# Altium schematic sheet Harici_Birimler.SchDoc
size A4; SheetNumber: 5; SheetTotal: 6
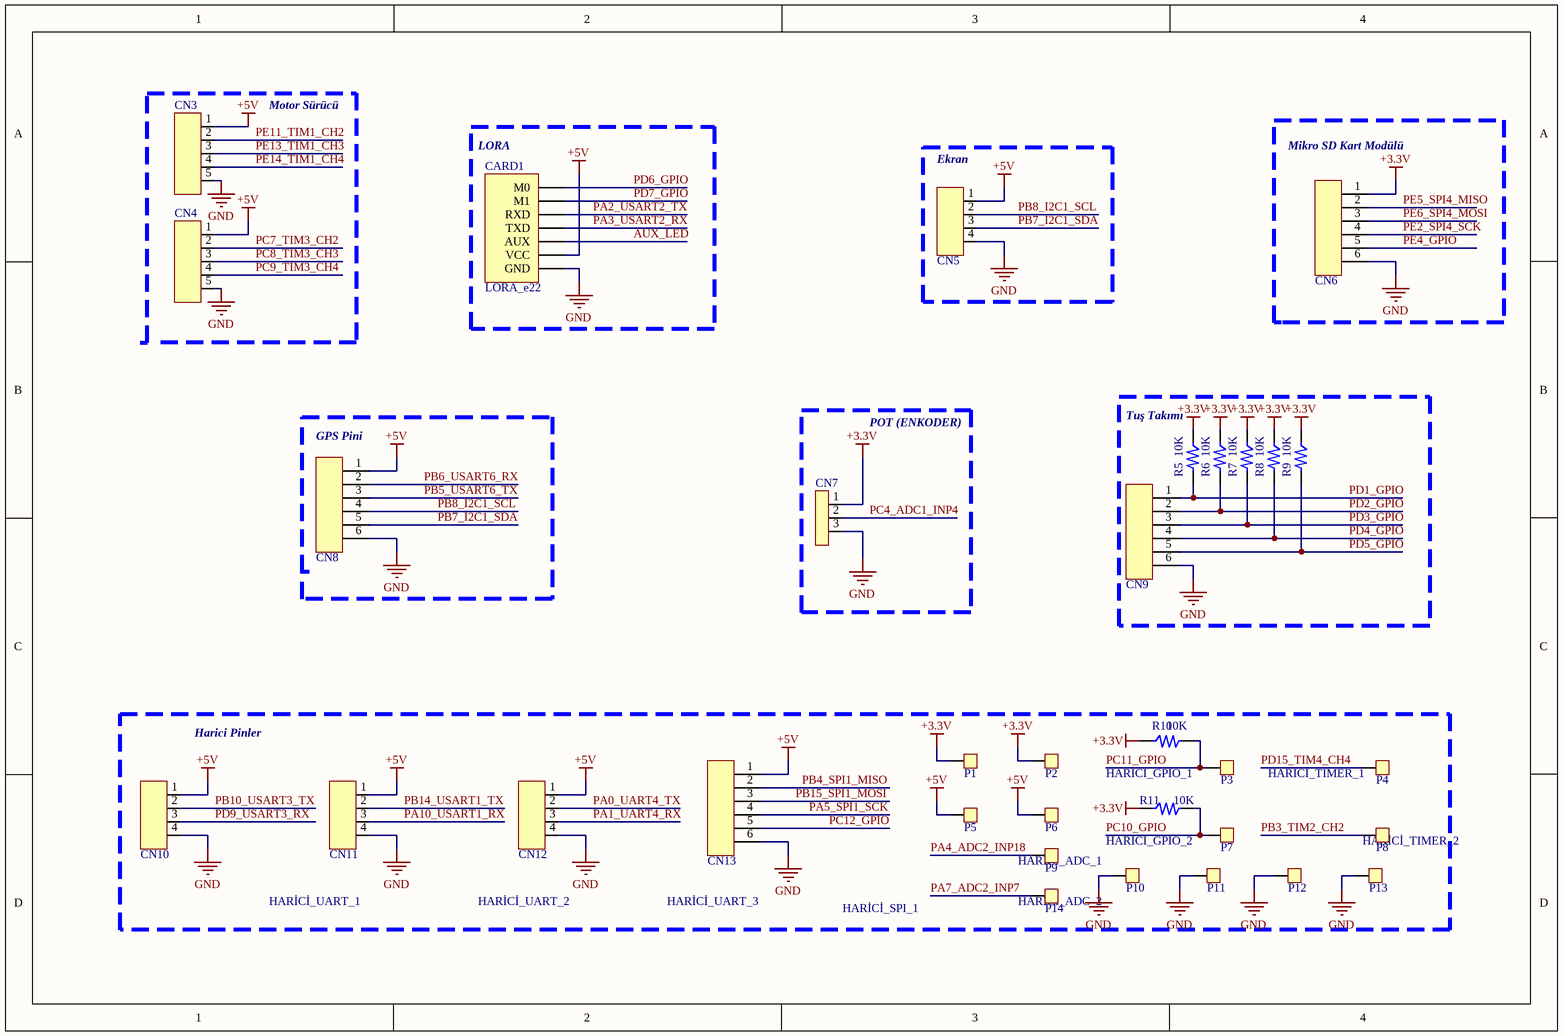
[diagram p0: Harici_Birimler.SchDoc]

## Parts
CARD1  LORA_e22  [LORA e22]
CN3  jst_conn_5_pin  [64800611622_CONN_5_PIN]  (value not drawn)
CN4  jst_conn_5_pin  [64800611622_CONN_5_PIN]  (value not drawn)
CN5  jst_conn_4_pin  [64800611622 _conn_4_pin]  (value not drawn)
CN6  jst_conn_6_pin  [64800611622_conn_6_pin]  (value not drawn)
CN7  3_Pin_Header  [3_PIN_HEADER]  (value not drawn)
CN8  jst_conn_6_pin  [64800611622_conn_6_pin]  (value not drawn)
CN9  jst_conn_6_pin  [64800611622_conn_6_pin]  (value not drawn)
CN10  jst_conn_4_pin  [64800611622 _conn_4_pin]  (value not drawn)
CN11  jst_conn_4_pin  [64800611622 _conn_4_pin]  (value not drawn)
CN12  jst_conn_4_pin  [64800611622 _conn_4_pin]  (value not drawn)
CN13  jst_conn_6_pin  [64800611622_conn_6_pin]  (value not drawn)
P1  ped  [ped]  (value not drawn)
P2  ped  [ped]  (value not drawn)
P3  ped  [ped]  (value not drawn)
P4  ped  [ped]  (value not drawn)
P5  ped  [ped]  (value not drawn)
P6  ped  [ped]  (value not drawn)
P7  ped  [ped]  (value not drawn)
P8  ped  [ped]  (value not drawn)
P9  ped  [ped]  (value not drawn)
P10  ped  [ped]  (value not drawn)
P11  ped  [ped]  (value not drawn)
P12  ped  [ped]  (value not drawn)
P13  ped  [ped]  (value not drawn)
P14  ped  [ped]  (value not drawn)
R5  value 10K  [RES_0603]  (hidden comment: RES_0603)
R6  value 10K  [RES_0603]  (hidden comment: RES_0603)
R7  value 10K  [RES_0603]  (hidden comment: RES_0603)
R8  value 10K  [RES_0603]  (hidden comment: RES_0603)
R9  value 10K  [RES_0603]  (hidden comment: RES_0603)
R10  value 10K  [RES_0603]  (hidden comment: RES_0603)
R11  value 10K  [RES_0603]  (hidden comment: RES_0603)

## Blocks framed on the sheet
Tuş Takımı: CN9 R5-R9

## Nets
+3.3V: CN6.1 CN7.1 P1.1 P2.1 R5.2 R6.2 R7.2 R8.2 R9.2 R10.2 R11.2
+5V: CARD1.6(VCC) CN3.1 CN4.1 CN5.1 CN8.1 CN10.1 CN11.1 CN12.1 CN13.1 P5.1 P6.1
GND: CARD1.7(GND) CN3.5 CN4.5 CN5.4 CN6.6 CN7.3 CN8.6 CN9.6 CN10.4 CN11.4 CN12.4 CN13.6 P10.1 P11.1 P12.1 P13.1
AUX_LED: CARD1.5(AUX)
PA0_UART4_TX: CN12.2
PA1_UART4_RX: CN12.3
PA2_USART2_TX: CARD1.3(RXD)
PA3_USART2_RX: CARD1.4(TXD)
PA4_ADC2_INP18: P9.1
PA5_SPI1_SCK: CN13.4
PA7_ADC2_INP7: P14.1
PA10_USART1_RX: CN11.3
PB3_TIM2_CH2: P8.1
PB4_SPI1_MISO: CN13.2
PB5_USART6_TX: CN8.3
PB6_USART6_RX: CN8.2
PB7_I2C1_SDA: CN5.3 CN8.5
PB8_I2C1_SCL: CN5.2 CN8.4
PB10_USART3_TX: CN10.2
PB14_USART1_TX: CN11.2
PB15_SPI1_MOSI: CN13.3
PC4_ADC1_INP4: CN7.2
PC7_TIM3_CH2: CN4.2
PC8_TIM3_CH3: CN4.3
PC9_TIM3_CH4: CN4.4
PC10_GPIO: P7.1 R11.1
PC11_GPIO: P3.1 R10.1
PC12_GPIO: CN13.5
PD1_GPIO: CN9.1 R5.1
PD2_GPIO: CN9.2 R6.1
PD3_GPIO: CN9.3 R7.1
PD4_GPIO: CN9.4 R8.1
PD5_GPIO: CN9.5 R9.1
PD6_GPIO: CARD1.1(M0)
PD7_GPIO: CARD1.2(M1)
PD9_USART3_RX: CN10.3
PD15_TIM4_CH4: P4.1
PE2_SPI4_SCK: CN6.4
PE4_GPIO: CN6.5
PE5_SPI4_MISO: CN6.2
PE6_SPI4_MOSI: CN6.3
PE11_TIM1_CH2: CN3.2
PE13_TIM1_CH3: CN3.3
PE14_TIM1_CH4: CN3.4

## Notes on the sheet
- Motor Sürücü
- (near CARD1) LORA
- (near CN5) Ekran
- (near CN6) Mikro SD Kart Modülü
- (near CN8) GPS Pini
- POT (ENKODER)
- Harici Pinler
- HARİCİ_GPIO_1
- (near P4) HARİCİ_TIMER_1
- HARİCİ_GPIO_2
- (near P8) HARİCİ_TIMER_2
- HARİCİ_UART_1
- HARİCİ_UART_2
- HARİCİ_UART_3
- HARİCİ_SPI_1
- HARİCİ_ADC_1
- (near P14) HARİCİ_ADC_2

## Library data of the parts
CN3 CN4 = 64800611622_conn_5_pin
CN5 CN10-CN12 = 64800611622 _conn_4_pin
CN6 CN8 CN9 CN13 = 64800611622 _conn_6_pin
CN7 = 3_Pin_2.54mm